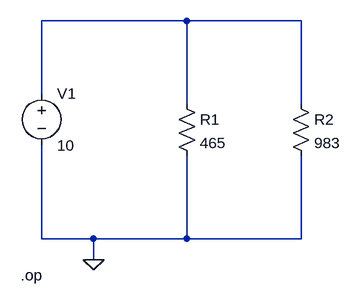
[diagram p0: schematic kcl.asc]
kcl.asc, the LTspice schematic file:
Version 4.1
SHEET 1 880 680
WIRE 240 0 16 0
WIRE 416 0 240 0
WIRE 16 112 16 0
WIRE 240 128 240 0
WIRE 416 128 416 0
WIRE 16 336 16 192
WIRE 96 336 16 336
WIRE 240 336 240 208
WIRE 240 336 96 336
WIRE 416 336 416 208
WIRE 416 336 240 336
WIRE 96 368 96 336
FLAG 96 368 0
SYMBOL voltage 16 96 R0
WINDOW 123 0 0 Left 0
WINDOW 39 0 0 Left 0
SYMATTR InstName V1
SYMATTR Value 10
SYMBOL res 224 112 R0
SYMATTR InstName R1
SYMATTR Value 465
SYMBOL res 400 112 R0
SYMATTR InstName R2
SYMATTR Value 983
TEXT -16 392 Left 2 !.op

The netlist it stands for:
* kcl.asc
V1 N001 0 10
R1 N001 0 465
R2 N001 0 983
.op
.backanno
.end